# Altium schematic sheet Controller_Sheet.SchDoc
size A4; SheetNumber: 2; SheetTotal: 6
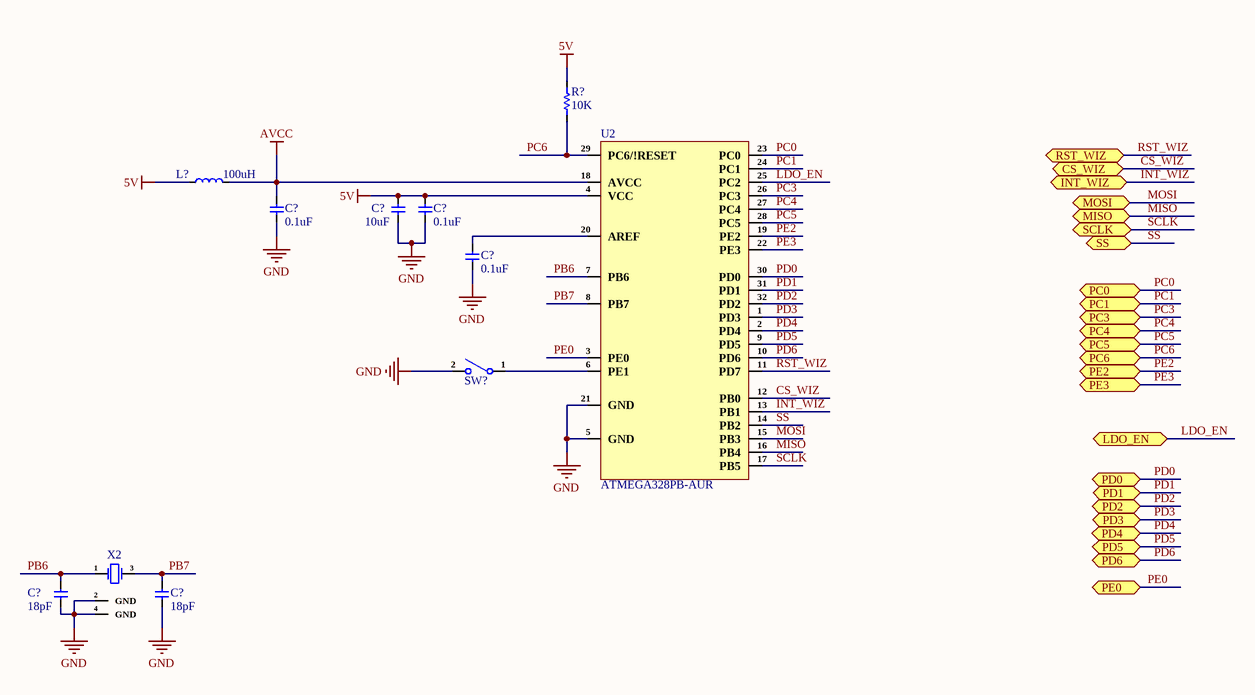
[diagram p0: Controller_Sheet.SchDoc]

## Parts
(Parts that share a designator on the sheet are numbered #1, #2 ... from top to bottom, then left to right.)
C?#1  0.1uF  [Cap-0603]
C?#2  10uF  [Cap-0603]
C?#3  0.1uF  [Cap-0603]
C?#4  0.1uF  [Cap-0603]
C?#5  18pF  [Cap-0603]
C?#6  18pF  [Cap-0603]
L?  100uH  [SDR1307A-101K]
R?  10K  [Res-0603]
SW?  TS-1185EC-C-D-B  [TS-1185EC-C-D-B_]  (value not drawn)
U2  ATMEGA328PB-AUR  [32 TQFP (7x7)]
X2  3TJ416000XYGBC  [SMD3225-4P]  (value not drawn)

## Ports
CS_WIZ (bidir, see Ethernet_Sheet[1C]), INT_WIZ (bidir, see Ethernet_Sheet[1C]), LDO_EN (bidir, see Power_Sheet[1D]), MISO (bidir, see Connector_Sheet[1D], Ethernet_Sheet[1D]), MOSI (bidir, see Connector_Sheet[1D], Ethernet_Sheet[1D]), PC0 (bidir, see Connector_Sheet[1D]), PC1 (bidir, see Connector_Sheet[1D]), PC3 (bidir, see Connector_Sheet[1D]), PC4 (bidir, see Connector_Sheet[1D]), PC5 (bidir, see Connector_Sheet[1D]), PC6 (bidir, see Connector_Sheet[1D]), PD0 (bidir, see Connector_Sheet[2D]), PD1 (bidir, see Connector_Sheet[2D]), PD2 (bidir, see Connector_Sheet[2D]), PD3 (bidir, see Connector_Sheet[2D]), PD4 (bidir, see Connector_Sheet[2D]), PD5 (bidir, see Connector_Sheet[2D]), PD6 (bidir, see Connector_Sheet[2D]), PE0 (bidir, see Connector_Sheet[2D]), PE2 (bidir, see Connector_Sheet[1D]), PE3 (bidir, see Connector_Sheet[1D]), RST_WIZ (bidir, see Ethernet_Sheet[1C]), SCLK (bidir, see Connector_Sheet[1D], Ethernet_Sheet[1D]), SS (bidir, see Connector_Sheet[1D])

## Nets
5V: C?#2.2 C?#3.2 L?.1 R?.2 U2.4(VCC)
AVCC: C?#1.2 L?.2 U2.18(AVCC)
GND: C?#1.1 C?#2.1 C?#3.1 C?#4.1 C?#5.1 C?#6.1 SW?.2 U2.5(GND) U2.21(GND) X2.2(GND) X2.4(GND)
CS_WIZ: U2.12(PB0) ; port CS_WIZ
INT_WIZ: U2.13(PB1) ; port INT_WIZ
LDO_EN: U2.25(PC2) ; port LDO_EN
MISO: U2.16(PB4) ; port MISO
MOSI: U2.15(PB3) ; port MOSI
PB6: C?#5.2 U2.7(PB6) X2.1(OSC1)
PB7: C?#6.2 U2.8(PB7) X2.3(OSC2)
PC0: U2.23(PC0) ; port PC0
PC1: U2.24(PC1) ; port PC1
PC3: U2.26(PC3) ; port PC3
PC4: U2.27(PC4) ; port PC4
PC5: U2.28(PC5) ; port PC5
PC6: R?.1 U2.29(PC6/!RESET) ; port PC6
PD0: U2.30(PD0) ; port PD0
PD1: U2.31(PD1) ; port PD1
PD2: U2.32(PD2) ; port PD2
PD3: U2.1(PD3) ; port PD3
PD4: U2.2(PD4) ; port PD4
PD5: U2.9(PD5) ; port PD5
PD6: U2.10(PD6) ; port PD6
PE0: U2.3(PE0) ; port PE0
PE2: U2.19(PE2) ; port PE2
PE3: U2.22(PE3) ; port PE3
RST_WIZ: U2.11(PD7) ; port RST_WIZ
SCLK: U2.17(PB5) ; port SCLK
SS: U2.14(PB2) ; port SS
NetC?#4_2: C?#4.2 U2.20(AREF)
NetSW?_1: SW?.1 U2.6(PE1)

## Notes on the sheet
- File:
- Title:
- Date:
- Page
- Num:
- Total:
- Drawn By: Huzaifa Ali

## Library data of the parts
C?#1 C?#3 C?#4 = CL10B104KB8NNNC: CAP CER 0.1UF 50V X7R 0603; Manufacturer: Samsung; Material: Ceramic; Capacitance: 100nF; Tolerance: 10%; Supplier 1: Digi-Key; Manufacturer Part Number: CL10B104KB8NNNC; RoHS: Yes; Category: Ceramic Capacitors; Stock 1: 3998791; Pricing 1: 1=0.10000, 10=0.03000, 50=0.01640, 100=0.01340, 500=0.00954, 1000=0.00750 (USD); Mount: Surface Mount; Case/Package: 0603; Case Code (Metric): 1608; Case Code (Imperial): 0603; Contact Plating: Tin; Min Operating Temperature: -55°C; Max Operating Temperature: 125°C; Dielectric: X7R; Voltage Rating: 50V; Package Quantity: 1; Packaging: Tape and Reel; Voltage: 50V; Voltage Rating (DC): 50V; Series: CL; Construction: Flat; Length: 1.6mm; Width: 0.031inch; Height: 0.8mm; Depth: 0.8mm; Thickness: 0.035inch; Radiation Hardening: No; Lead Free: Lead Free; RoHS Compliant: Yes; ComponentLink1URL: https://datasheet.ciiva.com/25803/cl10b104kb8nnnc-25803393.pdf?src-supplier=Digi-Key; ComponentLink1Description: https://datasheet.ciiva.com/25803/cl10b104kb8nnnc-25803393.pdf?src-supplier=Digi-Key; ComponentLink2URL: https://datasheet.ciiva.com/26838/getdatasheetpartid-89097-26838411.pdf?src-supplier=Verical; ComponentLink2Description: https://datasheet.ciiva.com/26838/getdatasheetpartid-89097-26838411.pdf?src-supplier=Verical; ComponentLink3URL: https://datasheet.ciiva.com/29198/456651-da-01-en-vs-kondensator-0605-29198839.pdf?src-supplier=Conrad; ComponentLink3Description: https://datasheet.ciiva.com/29198/456651-da-01-en-vs-kondensator-0605-29198839.pdf?src-supplier=Conrad; Supplier Part Number 1: 1276-1000-1-ND; LCSC Part Number: C1591
C?#2 = CL10A106MA8NRNC: CAP CER 10UF 25V X5R 0603; Manufacturer: Samsung; Tolerance: 20%; Supplier 1: Avnet; Manufacturer Part Number: CL10A106MA8NRNC; RoHS: Yes; Category: Ceramic Capacitors; Pricing 1: 4000=0.03753, 8000=0.03700, 16000=0.03595, 24000=0.03515, 32000=0.03383, 40000=0.03304, 400000=0.03225 (USD); Mount: Surface Mount; Case/Package: 0603; Case Code (Metric): 1608; Case Code (Imperial): 0603; Contact Plating: Tin; Min Operating Temperature: -55°C; Max Operating Temperature: 85°C; Package Quantity: 1; Packaging: Tape and Reel; Capacitance: 10uF; Voltage Rating: 25V; Dielectric: X5R; Termination: Wraparound; Series: CL; Construction: Flat; Length: 0.063inch; Width: 0.031inch; Thickness: 0.035inch; Lead Free: Lead Free; RoHS Compliant: Yes; ComponentLink1URL: https://datasheet.ciiva.com/25766/cl10a106ma8nrnc-25766562.pdf?src-supplier=Digi-Key; ComponentLink1Description: https://datasheet.ciiva.com/25766/cl10a106ma8nrnc-25766562.pdf?src-supplier=Digi-Key; Supplier Part Number 1: CL10A106MA8NRNC; LCSC Part Number: C96446
C?#5 C?#6 = CL10C180JB8NNNC: CAP CER 18PF 50V C0G/NP0 0603; Manufacturer: Samsung; Material: Ceramic; Tolerance: 5%; Dielectric: C0G; Temperature Coefficient: 300ppm/°C; Supplier 1: Arrow Electronics; Manufacturer Part Number: CL10C180JB8NNNC; RoHS: Yes; Category: Ceramic Capacitors; Stock 1: 1828000; Pricing 1: 4000=0.00360, 8000=0.00210 (USD); Mount: Surface Mount; Case/Package: 0603; Case Code (Metric): 1608; Case Code (Imperial): 0603; Contact Plating: Tin; Min Operating Temperature: -55°C; Max Operating Temperature: 125°C; Capacitance: 18pF; Voltage: 50V; Packaging: Tape and Reel; Voltage Rating: 50V; Series: CL; Construction: Flat; Length: 1.6mm; Width: 0.031inch; Height: 0.8mm; Depth: 0.8mm; Thickness: 0.035inch; Radiation Hardening: No; RoHS Compliant: Yes; ComponentLink1URL: https://datasheet.ciiva.com/25709/cl10c180jb8nnnc-25709670.pdf?src-supplier=Digi-Key; ComponentLink1Description: https://datasheet.ciiva.com/25709/cl10c180jb8nnnc-25709670.pdf?src-supplier=Digi-Key; ComponentLink2URL: https://datasheet.ciiva.com/26838/getdatasheetpartid-660083-26838496.pdf?src-supplier=Verical; ComponentLink2Description: https://datasheet.ciiva.com/26838/getdatasheetpartid-660083-26838496.pdf?src-supplier=Verical; ComponentLink3URL: https://datasheet.ciiva.com/29198/457219-da-01-en-vs-kondensator-0603-29198763.pdf?src-supplier=Conrad; ComponentLink3Description: https://datasheet.ciiva.com/29198/457219-da-01-en-vs-kondensator-0603-29198763.pdf?src-supplier=Conrad; ComponentLink4URL: https://datasheet.ciiva.com/26310/mlcc-catalogdownload2013-eng-26310310.pdf?src-supplier=Distrelec; ComponentLink4Description: https://datasheet.ciiva.com/26310/mlcc-catalogdownload2013-eng-26310310.pdf?src-supplier=Distrelec; Supplier Part Number 1: CL10C180JB8NNNC
L? = SDR1307A-101K: Ind Power Unshielded Wirewound 100uH 10% 100KHz 25Q-Factor Ferrite 1.9A T/R; Manufacturer: Bourns; Item Type: Inductor; Supplier: Digi-Key; Supplier Part Number: SDR1307A-101KCT-ND; Manufacturer Part Number: SDR1307A-101K; RoHS: Yes; Category: Fixed Inductors; Stock: 2952; Pricing: 1=1.16, 10=0.982, 25=0.8928, 50=0.8392, 100=0.6964 (USD); ComponentLink1URL: https://datasheet.ciiva.com/46435/1778094-46435133.pdf?src-supplier=Element14; ComponentLink1Description: https://datasheet.ciiva.com/46435/1778094-46435133.pdf?src-supplier=Element14; LCSC Part Number: C2042930; ComponentLink2Description: LCSC; ComponentLink2URL: https://www.lcsc.com/product-detail/Power-Inductors_BOURNS-SDR1307A-101K_C2042930.html
R? = RT0603BRD0710KL: RES SMD 10K OHM 0.1% 1/10W 0603; Manufacturer: Yageo; Power: 100mW; Rated Temperature: 70°C; Value: 10kR; Temperature Coefficient: 25ppm/°C; Working Voltage: 75V; Package Height: 0.45mm; Package Length: 1.6mm; Package Width: 0.8mm; Item Type: Resistor; Supplier 1: Rs; Manufacturer Part Number: RT0603BRD0710KL; RoHS: Yes; Category: Chip SMD Resistors; Stock 1: 20510; Pricing 1: 100=0.29800, 250=0.27800, 500=0.25900, 1000=0.23700 (GBP); Mounting Technology: Surface Mount; Pins: 2; Case/Package: 0603; Min Operating Temperature: -55°C; Max Operating Temperature: 155°C; Tolerance: 0.1%; Resistor Type: FIXED RESISTOR; Construction: Chip; Package Style: SMTMeter; Packaging: Tape and Reel; Technology: THIN FILM; Termination: Wraparound; Reach SVHC Compliant: Yes; RoHS Compliant: Yes; ComponentLink1URL: https://datasheet.ciiva.com:443/pdfs/VipMasterIC/IC/YAGO/YAGO-S-A0008510989/YAGO-S-A0008510989-1.pdf?src-supplier=IHS+Markit; ComponentLink1Description: https://datasheet.ciiva.com:443/pdfs/VipMasterIC/IC/YAGO/YAGO-S-A0008510989/YAGO-S-A0008510989-1.pdf?src-supplier=IHS+Markit; ComponentLink2URL: https://datasheet.ciiva.com/5624/pyu-rt-1-to-0-05-rohs-l-4-5624351.pdf?src-supplier=Mouser; ComponentLink2Description: https://datasheet.ciiva.com/5624/pyu-rt-1-to-0-05-rohs-l-4-5624351.pdf?src-supplier=Mouser; ComponentLink3URL: https://datasheet.ciiva.com/29721/pyu-rt-1-to-0-05-rohs-l-4-29721177.pdf?src-supplier=Digi-Key; ComponentLink3Description: https://datasheet.ciiva.com/29721/pyu-rt-1-to-0-05-rohs-l-4-29721177.pdf?src-supplier=Digi-Key; Supplier Part Number 1: 1991391P; LCSC Part Number: C95204
SW? = TS-1185EC-C-D-B: 3mm 2mm Round Button 50mA Top3.65mm SPST 12V SMD Tactile Switches; Manufacturer: XKB; Manufacturer Part Number: TS-1185EC-C-D-B; Footprint: Custom; ComponentLink1Description: LCSC; ComponentLink1URL: https://lcsc.com/product-detail/Tactile-Switches_XKB-Connectivity-TS-1185EC-C-D-B_C318893.html; LCSC Part Number: C318893
U2 = ATMEGA328PB-AUR: IC MCU 8BIT 32KB FLASH 32TQFP; Manufacturer: Microchip; Number of A/D Converters: 1NUMBER; Number of ADC Channels: 8NUMBER; Number of I2C Channels: 2NUMBER; Number of PWM Channels: 10NUMBER; Supplier: Digikey; Supplier Part Number: ATMEGA328PB-AURCT-ND; Manufacturer Part Number: ATMEGA328PB-AUR; RoHS: No; Category: Microcontrollers; Stock: 17600; Pricing: 1=1.7, 25=1.56, 100=1.41 (USD); Number of SPI Channels: 2NUMBER; Number of UART Channels: 2NUMBER; Height: 1.2mm; ComponentLink1URL: http://www.atmel.com/images/atmel-42397-8-bit-avr-microcontroller-atmega328pb_summary.pdf?src-supplier=Avnet; ComponentLink1Description: http://www.atmel.com/images/atmel-42397-8-bit-avr-microcontroller-atmega328pb_summary.pdf?src-supplier=Avnet; ComponentLink2URL: http://www.microchip.com/mymicrochip/filehandler.aspx?ddocname=en589666&src-supplier=Digikey; ComponentLink2Description: http://www.microchip.com/mymicrochip/filehandler.aspx?ddocname=en589666&src-supplier=Digikey; ComponentLink3URL: https://datasheet.octopart.com/ATMEGA328PB-AUR-Microchip-datasheet-154741725.pdf?src-supplier=Electro+Sonic; ComponentLink3Description: https://datasheet.octopart.com/ATMEGA328PB-AUR-Microchip-datasheet-154741725.pdf?src-supplier=Electro+Sonic; ComponentLink4URL: https://datasheet.octopart.com/ATMEGA328PB-AUR-Microchip-datasheet-136376163.pdf?src-supplier=SHENGYU+ELECTRONICS; ComponentLink4Description: https://datasheet.octopart.com/ATMEGA328PB-AUR-Microchip-datasheet-136376163.pdf?src-supplier=SHENGYU+ELECTRONICS
X2 = 3TJ416000XYGBC: 16MHz 贴片晶振 18pF ±10ppm ±30ppm SMD3225-4P Crystals ROHS; Manufacturer: JYJE; Supplier: LCSC; LCSC Part Number: C2149027; Manufacturer Part Number: 3TJ416000XYGBC; RoHS: No; Item Type: Crystal